# Altium schematic sheet INPUT_SUPPLY_PROTECTION.SchDoc
size A4; SheetNumber: 16; SheetTotal: 20
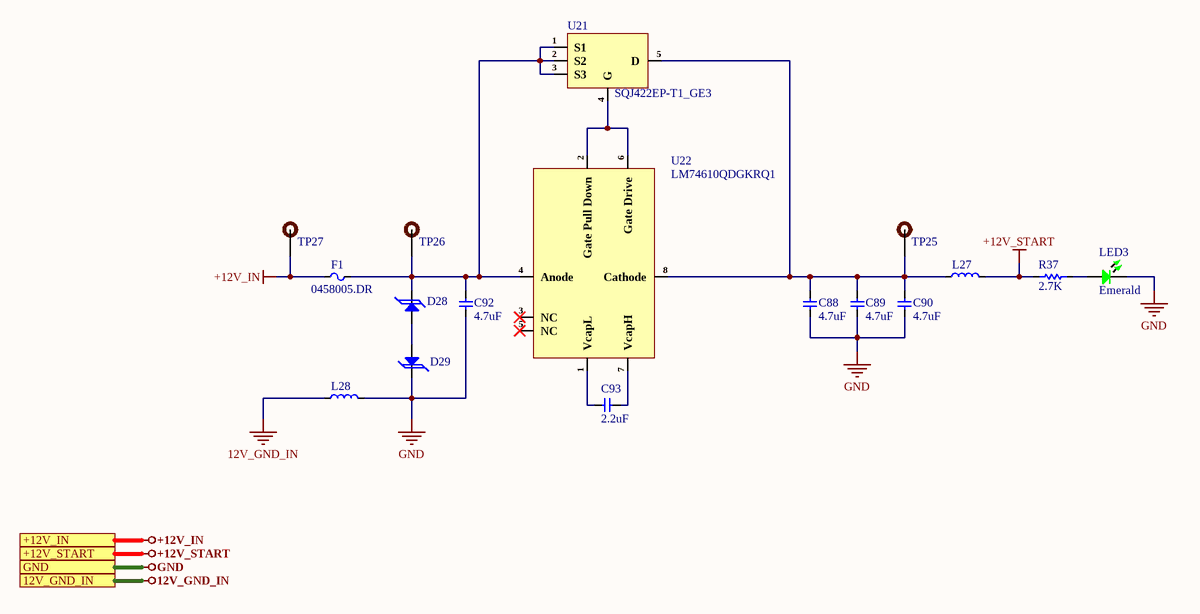
[diagram p0: INPUT_SUPPLY_PROTECTION.SchDoc]

## Parts
C88  4.7uF  [Cap-1206]
C89  4.7uF  [Cap-1206]
C90  4.7uF  [Cap-1206]
C92  4.7uF  [Cap-1206]
C93  2.2uF  [Cap-1206]
D28  SMBJ28A-13-F  [SMB_]  (value not drawn)
D29  SMBJ28A-13-F  [SMB_]  (value not drawn)
F1  0458005.DR  [0458005.DR]
L27  BLM41PG600SH1L  [IND 1806]  (value not drawn)
L28  BLM15AX601SN1D  [IND-0402]  (value not drawn)
LED3  Emerald  [LED-0603]
R37  2.7K  [Res-0603]
TP25  DNP  [Test-point]  (value not drawn)
TP26  DNP  [Test-point]  (value not drawn)
TP27  DNP  [Test-point]  (value not drawn)
U21  SQJ422EP-T1_GE3  [PowerPAK® SO-8]
U22  LM74610QDGKRQ1  [VSSOP-8 (3x3)]

## Ports
12V_GND_IN (see Top_Sheet[2D], CONNECTORS[1D]), +12V_IN (see Top_Sheet[3D], CONNECTORS[1D]), +12V_START (see Top_Sheet[3D], CONNECTORS[1D], DC_DC_CONVERTER[1D], DIGITAL_I-O_O-P[1D]), GND (see Top_Sheet[2D], 03-CAN2_SPI_CAN_CONTROLLER[1D], APALIS_POWER_SUPPLY[1D], CAN2_SPI_CAN_CONTROLLER[1D], CODEC_INTERFACE[1D], CONNECTORS[1D], DC_DC_CONVERTER[1D], DIGITAL_I-O_O-P[1D], ETHERNET_INTERFACE[1D], FUTURE_USE_CONNECTOR[1D], GPIO_NC_INTERFACE[4B], HDMI_INTERFACE[1D], I2C_INTERFACE[1B], LTE_MODULE[1D], MECHANICAL_FOR_PCB[1D], MICRO_SD_CARD_INTERFACE[1D], Reset_and_SDIO[1D], UART_INTERFACE[1D], USB3.0_INTERFACE[1D])

## Nets
12V_GND_IN: L28.1 ; port 12V_GND_IN
+12V_IN: F1.1 TP27.1 ; port +12V_IN
+12V_START: L27.2 R37.1 ; port +12V_START
GND: C88.1 C89.1 C90.1 C92.1 D29.2(K) L28.2 LED3.2 ; port GND
NetC88_2: C88.2 C89.2 C90.2 L27.1 TP25.1 U21.5(D) U22.8(Cathode)
NetC92_2: C92.2 D28.2(K) F1.2 TP26.1 U21.1(S1) U21.2(S2) U21.3(S3) U22.4(Anode)
NetC93_1: C93.1 U22.1(VcapL)
NetC93_2: C93.2 U22.7(VcapH)
NetD28_1: D28.1(A) D29.1(A)
NetLED3_1: LED3.1 R37.2
NetU21_4: U21.4(G) U22.2(Gate_Pull_Down) U22.6(Gate_Drive)

Not connected (* = marked no-connect by the designer): U22 3(NC)* 5(NC)*

## Library data of the parts
C88-C90 C92 = C1206C475M5RACAUTO: CAP CER 4.7UF 50V X7R 1206; Manufacturer: KEMET; Supplier: Mouser; Supplier Part Number: 80-C1206C475M5RAUTO; Manufacturer Part Number: C1206C475M5RACAUTO; RoHS: Yes; Category: Ceramic Capacitors; Stock: 75276; Pricing: 1=0.63, 10=0.443, 50=0.443, 100=0.292, 1000=0.204, 10000=0.149 (USD)
C93 = C1206C225K5RACAUTO7210: CAP CER 2.2UF 50V X7R 1206; Manufacturer: KEMET; Supplier: Mouser; Supplier Part Number: 80-C1206C225K5RAUTLR; Manufacturer Part Number: C1206C225K5RACAUTO7210; RoHS: Yes; Category: Ceramic Capacitors; Stock: 62340; Pricing: 1=0.34, 10=0.231, 50=0.231, 100=0.131, 1000=0.081, 10000=0.063 (USD); ComponentLink1URL: https://api.kemet.com/component-edge/download/datasheet/C1206C225K5RACAUTO7210.pdf?src-supplier=Digi-Key; ComponentLink1Description: https://api.kemet.com/component-edge/download/datasheet/C1206C225K5RACAUTO7210.pdf?src-supplier=Digi-Key; ComponentLink2URL: https://datasheet.octopart.com/C1206C225K5RACAUTO7210-KEMET-datasheet-149525492.pdf?src-supplier=Farnell; ComponentLink2Description: https://datasheet.octopart.com/C1206C225K5RACAUTO7210-KEMET-datasheet-149525492.pdf?src-supplier=Farnell
D28 D29 = SMBJ28A-13-F: TVS DIODE 28VWM 45.4VC SMB; Manufacturer: Diodes; Supplier: Future Electronics; Supplier Part Number: 4657243; Manufacturer Part Number: SMBJ28A-13-F; RoHS: Yes; Category: TVS Diodes; Stock: 111; Pricing: 1=0.37, 15=0.295, 75=0.25, 300=0.215, 1500=0.169 (USD); ComponentLink1URL: https://datasheet.ciiva.com/26912/getdatasheetpartid-234000-26912533.pdf?src-supplier=Verical; ComponentLink1Description: https://datasheet.ciiva.com/26912/getdatasheetpartid-234000-26912533.pdf?src-supplier=Verical; ComponentLink2URL: https://datasheet.ciiva.com/16387/ds19002-16387564.pdf?src-supplier=Future+Electronics; ComponentLink2Description: https://datasheet.ciiva.com/16387/ds19002-16387564.pdf?src-supplier=Future+Electronics
F1 = 0458005.DR: Fuse Chip Fast Acting 5A 75V SMD Solder Pad 1206 Ceramic T/R Automotive cULus; Manufacturer: Littelfuse; Supplier: Rs; Supplier Part Number: 1740294; Manufacturer Part Number: 0458005.DR; RoHS: Yes; Category: Fuses; Stock: 1005; Pricing: 1=0.62077, 10=0.73892, 25=0.71895, 50=0.70003 (GBP); ComponentLink1URL: https://datasheet.ciiva.com/1730/337915-1730547.pdf?src-supplier=Newark; ComponentLink1Description: https://datasheet.ciiva.com/1730/337915-1730547.pdf?src-supplier=Newark; ComponentLink2URL: https://datasheet.ciiva.com/7991/337915-7991910.pdf?src-supplier=Element14; ComponentLink2Description: https://datasheet.ciiva.com/7991/337915-7991910.pdf?src-supplier=Element14; ComponentLink3URL: https://datasheet.ciiva.com/299/littelfuse-fuse-458-series-299786.pdf?src-supplier=Digi-Key; ComponentLink3Description: https://datasheet.ciiva.com/299/littelfuse-fuse-458-series-299786.pdf?src-supplier=Digi-Key; ComponentLink4URL: https://datasheet.ciiva.com/299/littelfuse-fuse-458-series-299787.pdf?src-supplier=Digi-Key; ComponentLink4Description: https://datasheet.ciiva.com/299/littelfuse-fuse-458-series-299787.pdf?src-supplier=Digi-Key; ComponentLink5URL: https://datasheet.ciiva.com/299/littelfuse-fuse-458-series-299788.pdf?src-supplier=Digi-Key; ComponentLink5Description: https://datasheet.ciiva.com/299/littelfuse-fuse-458-series-299788.pdf?src-supplier=Digi-Key
L27 = BLM41PG600SH1L: FERRITE BEAD 60 OHM 1806 1LN; Manufacturer: Murata; Impedance: 60R; Tolerance: 25%; Max Current Rating: 6A; Number of Lines: 1; Test Frequency: 100MHz; Shielding: Unshielded; Supplier: Rs; Supplier Part Number: 1048549; Manufacturer Part Number: BLM41PG600SH1L; RoHS: Yes; Category: Ferrite Beads and Chips; Stock: 2410; Pricing: 10=0.2, 50=0.169, 100=0.15, 500=0.13, 2000=0.12 (GBP); Mounting Technology: Surface Mount; Case/Package: 1806; Case Code (Metric): 4516; Case Code (Imperial): 1806; Contact Plating: Tin,Matte; Min Operating Temperature: -55°C; Max Operating Temperature: 125°C; Package Quantity: 1; Packaging: Tape and Reel; Max DC Current: 6A; Termination: SMD/SMT; Series: EMIFIL®, BLM41P; Length: 4.5mm; Width: 0.063inch; Height: 0.071inch; Ratings: AEC-Q200; Reach SVHC Compliant: No; Lead Free: Lead Free; RoHS Compliant: Yes; ComponentLink1URL: https://datasheet.ciiva.com/29364/l0132s0193blm41p-29364181.pdf?src-supplier=Digi-Key; ComponentLink1Description: https://datasheet.ciiva.com/29364/l0132s0193blm41p-29364181.pdf?src-supplier=Digi-Key; ComponentLink2URL: https://datasheet.ciiva.com/3067/c31e-3067201.pdf?src-supplier=Avnet; ComponentLink2Description: https://datasheet.ciiva.com/3067/c31e-3067201.pdf?src-supplier=Avnet
L28 = BLM15AX601SN1D: FERRITE BEAD 600 OHM 0402 1LN; Manufacturer: Murata; Material: Steel,Ferrite; Tolerance: 25%; Impedance: 600R; Current Rating: 500mA; Number of Lines: 1; DC Resistance (DCR): 340mR; Test Frequency: 100MHz; Supplier: Rs; Supplier Part Number: 8390786P; Manufacturer Part Number: BLM15AX601SN1D; RoHS: Yes; Category: Ferrite Beads and Chips; Stock: 31900; Pricing: 1000=0.019, 2000=0.016, 5000=0.014, 10000=0.013 (GBP); Case/Package: 0402; Pins: 2; Case Code (Metric): 1005; Case Code (Imperial): 0402; Core Material: Ferrite; Min Operating Temperature: -55°C; Max Operating Temperature: 125°C; Package Quantity: 1; Packaging: Tape and Reel; Max Current Rating: 500mA; Termination: SMD/SMT; Max DC Current: 500mA; Number of Circuits: 1; Series: BLM15AX_SN; DC Resistance-Max: 340mR; RMS Current (Irms): 500mA; ESR: 340mR; Length: 1mm; Width: 0.5mm; Height: 0.5mm; Depth: 0.5mm; Reach SVHC Compliant: No; Lead Free: Lead Free; RoHS Compliant: Yes; ComponentLink1URL: https://datasheet.ciiva.com/1012/l0110s0100blm15ax-sn-1012320.pdf?src-supplier=Digi-Key; ComponentLink1Description: https://datasheet.ciiva.com/1012/l0110s0100blm15ax-sn-1012320.pdf?src-supplier=Digi-Key; ComponentLink2URL: https://datasheet.ciiva.com/41425/001171675-da-01-en-chip-drossel0402-600r-420ma-1-0x0-5mm-41425713.pdf?src-supplier=Conrad; ComponentLink2Description: https://datasheet.ciiva.com/41425/001171675-da-01-en-chip-drossel0402-600r-420ma-1-0x0-5mm-41425713.pdf?src-supplier=Conrad; ComponentLink3URL: https://datasheet.ciiva.com/41449/001172169-da-01-en-drossel-0402-600r-1-0x0-5mm-10000st-41449458.pdf?src-supplier=Conrad; ComponentLink3Description: https://datasheet.ciiva.com/41449/001172169-da-01-en-drossel-0402-600r-1-0x0-5mm-10000st-41449458.pdf?src-supplier=Conrad; ComponentLink4URL: https://datasheet.ciiva.com/1012/l0110e-1012321.pdf?src-supplier=Digi-Key; ComponentLink4Description: https://datasheet.ciiva.com/1012/l0110e-1012321.pdf?src-supplier=Digi-Key; ComponentLink5URL: https://datasheet.ciiva.com/1012/l0110e-1012322.pdf?src-supplier=Digi-Key; ComponentLink5Description: https://datasheet.ciiva.com/1012/l0110e-1012322.pdf?src-supplier=Digi-Key; ComponentLink6URL: https://datasheet.ciiva.com/16420/l0110s0100blm15ax-sn-16420781.pdf?src-supplier=Future+Electronics; ComponentLink6Description: https://datasheet.ciiva.com/16420/l0110s0100blm15ax-sn-16420781.pdf?src-supplier=Future+Electronics
LED3 = NCD0603G2: Emerald 0603 Light Emitting Diodes (LED) ROHS; Manufacturer: Foshan NationStar Optoelectronics; Manufacturer Part Number: NCD0603G2; Package: 0603; LCSC Part Number: C87326; Item Type: LED; ComponentLink1Description: LCSC; ComponentLink1URL: https://www.lcsc.com/product-detail/Light-Emitting-Diodes-LED_Foshan-NationStar-Optoelectronics-NCD0603G2_C87326.html
R37 = ERA-3AEB272V: RES SMD 2.7K OHM 0.1% 1/10W 0603; Manufacturer: Panasonic; Supplier: Mouser; Supplier Part Number: 667-ERA-3AEB272V; Manufacturer Part Number: ERA-3AEB272V; RoHS: Yes; Category: Chip SMD Resistors; Stock: 13910; Pricing: 1=0.34, 10=0.224, 50=0.224, 100=0.09, 1000=0.05, 10000=0.036 (USD); ComponentLink1URL: https://datasheet.ciiva.com/11808/0900766b80fe20f7-11808049.pdf?src-supplier=Rs; ComponentLink1Description: https://datasheet.ciiva.com/11808/0900766b80fe20f7-11808049.pdf?src-supplier=Rs; ComponentLink2URL: https://datasheet.ciiva.com/29183/450927-da-01-en-widerstand-0603-era-29183778.pdf?src-supplier=Conrad; ComponentLink2Description: https://datasheet.ciiva.com/29183/450927-da-01-en-widerstand-0603-era-29183778.pdf?src-supplier=Conrad; ComponentLink3URL: https://datasheet.ciiva.com/9196/aoa0000ce26-9196935.pdf?src-supplier=Avnet; ComponentLink3Description: https://datasheet.ciiva.com/9196/aoa0000ce26-9196935.pdf?src-supplier=Avnet; ComponentLink4URL: https://datasheet.ciiva.com/43457/485442-43457768.pdf?src-supplier=Farnell; ComponentLink4Description: https://datasheet.ciiva.com/43457/485442-43457768.pdf?src-supplier=Farnell; ComponentLink5URL: https://datasheet.ciiva.com/43455/485442-43455224.pdf?src-supplier=Farnell; ComponentLink5Description: https://datasheet.ciiva.com/43455/485442-43455224.pdf?src-supplier=Farnell; ComponentLink6URL: https://datasheet.ciiva.com/48530/era-eng-tds-48530485.pdf?src-supplier=Distrelec; ComponentLink6Description: https://datasheet.ciiva.com/48530/era-eng-tds-48530485.pdf?src-supplier=Distrelec; ComponentLink7URL: https://datasheet.ciiva.com/48425/era-eng-tds-48425448.pdf?src-supplier=Distrelec; ComponentLink7Description: https://datasheet.ciiva.com/48425/era-eng-tds-48425448.pdf?src-supplier=Distrelec; ComponentLink8URL: https://datasheet.ciiva.com/46422/485442-46422632.pdf?src-supplier=Element14; ComponentLink8Description: https://datasheet.ciiva.com/46422/485442-46422632.pdf?src-supplier=Element14; ComponentLink9URL: https://datasheet.ciiva.com/46422/485442-46422633.pdf?src-supplier=Element14; ComponentLink9Description: https://datasheet.ciiva.com/46422/485442-46422633.pdf?src-supplier=Element14; ComponentLink10URL: https://datasheet.ciiva.com/46422/485442-46422634.pdf?src-supplier=Element14; ComponentLink10Description: https://datasheet.ciiva.com/46422/485442-46422634.pdf?src-supplier=Element14; ComponentLink11URL: https://datasheet.ciiva.com/6000/485442-6000521.pdf?src-supplier=Farnell; ComponentLink11Description: https://datasheet.ciiva.com/6000/485442-6000521.pdf?src-supplier=Farnell; ComponentLink12URL: https://datasheet.ciiva.com/6000/485442-6000524.pdf?src-supplier=Farnell; ComponentLink12Description: https://datasheet.ciiva.com/6000/485442-6000524.pdf?src-supplier=Farnell
TP25-TP27 = TEST POINT: Test Point ON; Item Type: TEST POINT
U21 = SQJ422EP-T1_GE3: MOSFET N-CH 40V 74A PPAK SO-8; Manufacturer: Vishay; Supplier: Mouser; Supplier Part Number: 781-SQJ422EP-T1_GE3; Manufacturer Part Number: SQJ422EP-T1_GE3; RoHS: Yes; Category: MOSFETs; Stock: 26296; Pricing: 1=1.62, 10=1.43, 50=1.43, 100=1.18, 1000=0.798, 10000=0.714 (USD); ComponentLink1URL: https://datasheet.ciiva.com/28599/1760635-28599505.pdf?src-supplier=Element14; ComponentLink1Description: https://datasheet.ciiva.com/28599/1760635-28599505.pdf?src-supplier=Element14; ComponentLink2URL: https://datasheet.ciiva.com/29745/sqj422ep-29745736.pdf?src-supplier=Digi-Key; ComponentLink2Description: https://datasheet.ciiva.com/29745/sqj422ep-29745736.pdf?src-supplier=Digi-Key
U22 = LM74610QDGKRQ1: IC SMART DIODE CTLR 8VSSOP; Manufacturer: Texas Instruments; Supplier: Mouser; Supplier Part Number: 595-LM74610QDGKRQ1; Manufacturer Part Number: LM74610QDGKRQ1; RoHS: Yes; Category: Power Management ICs; Stock: 5066; Pricing: 1=2.47, 10=2.1, 50=2.1, 100=1.83, 1000=1.31, 10000=1.14 (USD); ComponentLink1URL: http://www.ti.com/lit/ds/symlink/lm74610-q1.pdf?src-supplier=Digi-Key; ComponentLink1Description: http://www.ti.com/lit/ds/symlink/lm74610-q1.pdf?src-supplier=Digi-Key